# Altium schematic sheet Sheet1.SchDoc (part 2 of 2)
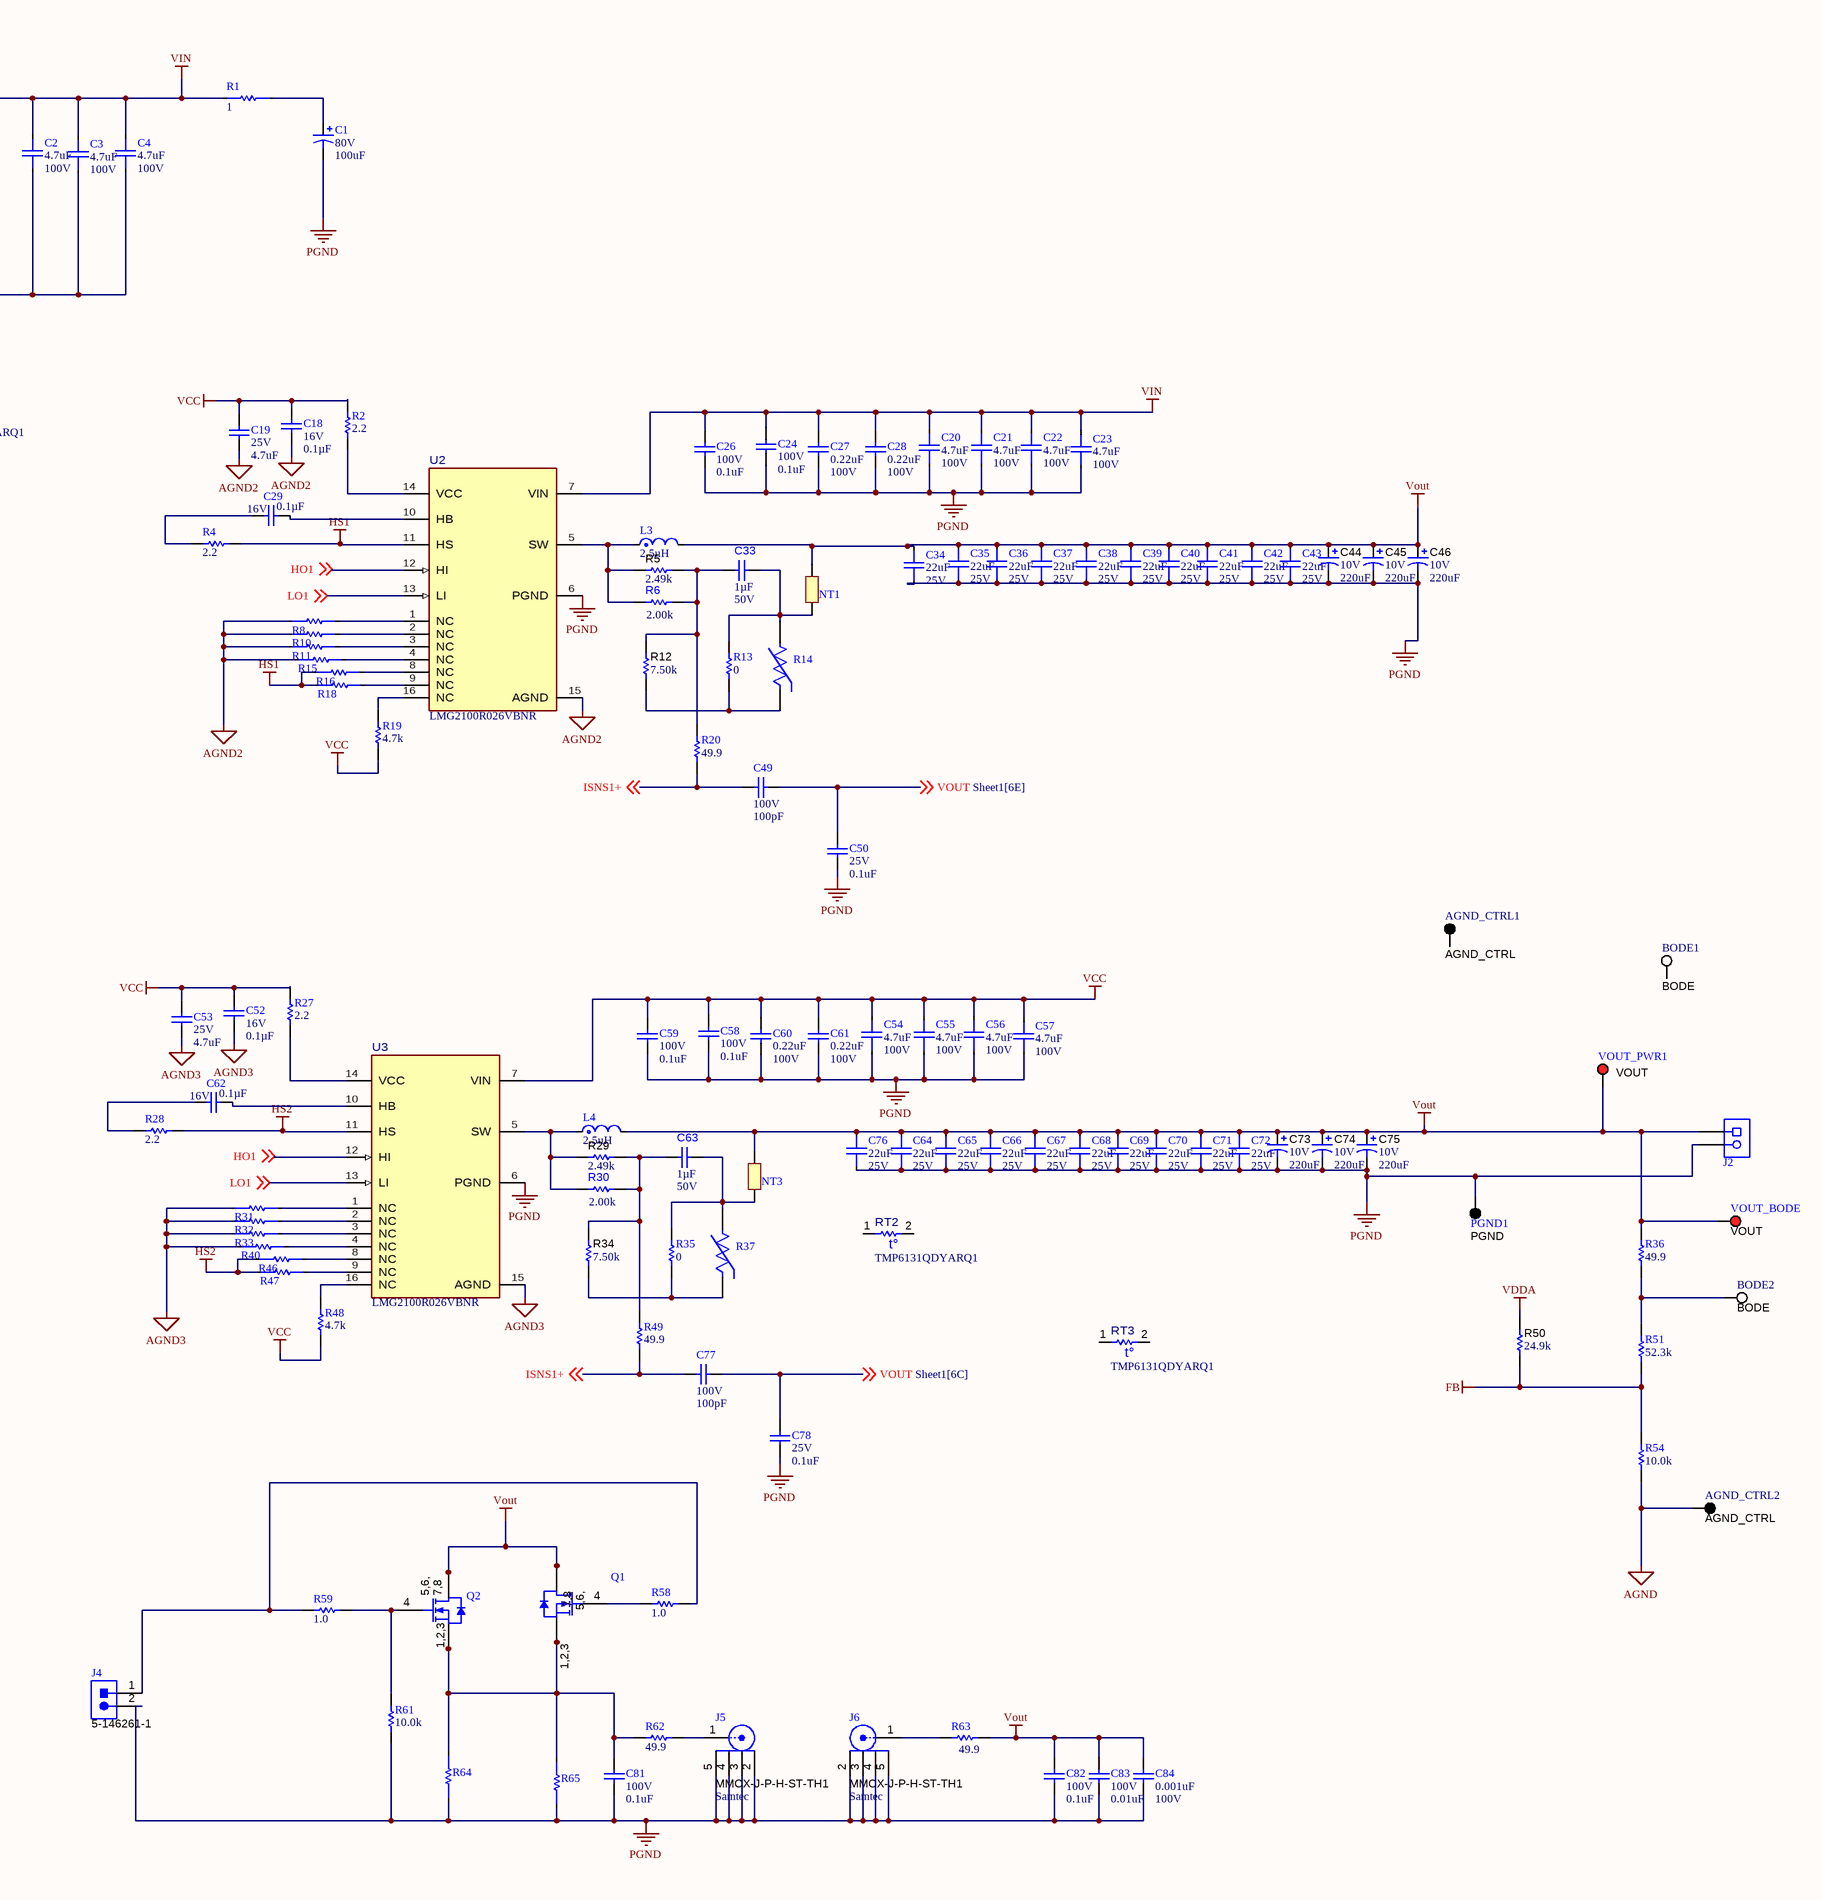
[diagram p2: Sheet1.SchDoc, right]

## Library data of the parts
AGND_CTRL1 AGND_CTRL2 = 5011_AGND_CTRL: Test Point, Multipurpose, Black, TH | PMP23611: AGND_CTRL1; PartNumber: 5011; Manufacturer: Keystone Electronics; CNHeader: FALSE; ContactFinish: Silver; Green_REACh: Passed; Green_Lifecycle: Active; CT: TRUE; ComponentLink1Description: Datasheet URL; Supplier 1: Digi-Key; MountType: TH; Supplier 2: Mouser; LatestRevisionDate: 26/05/2017; Publisher: Texas Instruments; Color: Black; ComponentLink1URL: http://www.keyelco.com/userAssets/file/M60-2p60.pdf; Green_EU RoHS-2: Incomplete; Supplier Part Number 1: 36-5011-ND; Supplier Part Number 2: 534-5011; Green_EU RoHS: Passed; RoHS: Y; PackageReference: Black Multipurpose Testpoint; CompType: Test Point
BODE1 BODE2 = 5012: Test Point, Multipurpose, White, TH | PMP23611: BODE; Manufacturer: Keystone Electronics; ContactFinish: Silver; CT: TRUE; CNHeader: FALSE; Green_Lifecycle: Active; Green_REACh: Passed; Supplier Part Number 2: 534-5012; ComponentLink1Description: Datasheet URL; ComponentLink1URL: http://www.keyelco.com/userAssets/file/M60-2p60.pdf; CompType: Test Point; PackageReference: White Multipurpose Testpoint; RoHS: Y; Green_EU RoHS: Passed; PartNumber: 5012; Green_EU RoHS-2: Incomplete; MountType: TH; Supplier Part Number 1: 36-5012-ND; Color: White; Supplier 2: Mouser; Publisher: Texas Instruments; Supplier 1: Digi-Key; LatestRevisionDate: 26/05/2017
C1 = CMP-0011216-2: CAP, AL, 100 uF, 80 V, +/- 20%, 0.32 ohm, AEC-Q200 Grade 2, SMD; Manufacturer: Panasonic; TaMin_C: -55°C; ESR_ohm: 0.32; Polarized: Y; SizeAreaWB_mm2: 263.5; U/M: EA; Value: 100uF; TaMax_C: 105°C; SizeZ_mm: 13.5; SizeX_mm: 15; Cap_Case: H13; SizeArea_mm2: 202.5; CompType: Capacitor; Cap_F: 100µF; IRMS_A: 500mA; AEC Grade: 2; AEC Category: Q200; Supplier Part Number 2: 667-EEV-FK1K101Q; Publisher: Texas Instruments; Supplier 2: Mouser; Supplier Part Number 3: 9696113; Supplier 3: Farnell; RoHS: Y; Value1: 0.32 ohm; MountType: SMT; Supplier 1: Digi-Key; PackageReference: SMT Radial H13; Tolerance_%: 20%; SizeY_mm: 13.5; Value2: 80V; LatestRevisionDate: 2017-03-09; PartNumber: EEV-FK1K101Q; AEC Qualified: Y; Series: FK; ComponentLink1Description: Datasheet link; Supplier Part Number 1: PCE3493CT-ND; Technology: AL; ComponentLink1URL: https://industrial.panasonic.com/cdbs/www-data/pdf/RDE0000/ABA0000C1181.pdf
C2-C15 C20-C23 C54-C57 = CMP-0093675-1: 4.7uF ±10% 100V Ceramic Capacitor X7S 1210 (3225 Metric); Manufacturer: Murata; Value: 4.7µF; AEC Qualified: Yes; TempCo: 22%; SizeZ_mm: 2.3mm; AEC Grade: Grade 1; Part Number: GCJ32DC72A475KE01L; helpURL: https://upverter.com/upn/revision/54580131a15fb126/; RoHS: TRUE; PartNumber: GCJ32DC72A475KE01L; PackageReference: 1210; ComponentLink1Description: Datasheet; Tolerance_%: 10%; Datasheet Path: datasheets/Cap-GCJ32DC72A475KE01L.pdf; Cap_F: 4.7µF; Lead Free: Yes; Operating Temperature Range: -55°C to +125°C; Temperature Characteristic: X7S; ComponentLink1URL: https://www.murata.com/en-us/products/productdetail?partno=GCJ32DC72A475KE01%23; datasheet: https://www.murata.com/en-us/products/productdetail?partno=GCJ32DC72A475KE01%23
C16 = CMP-0007468-5: CAP, CERM, 0.01 uF, 100 V, +/- 10%, X7R, 0603; Manufacturer: MuRata; TaMin_C: -55°C; Polarized: N; SizeAreaWB_mm2: 4.68; Value1: Unknown; U/M: EA; Value: 0.01uF; TaMax_C: 125°C; SizeZ_mm: 1; SizeX_mm: 1.6; SizeY_mm: 0.8; SizeArea_mm2: 1.28; CompType: Capacitor; Cap_F: 10nF; AEC Category: Q200; Supplier Part Number 2: 81-GRM188R72A103KA1D; Publisher: Texas Instruments; Supplier 2: Mouser; TempCo: X7R; Published: 2008-06-19; RoHS: Y; MountType: SMT; Supplier 1: Digi-Key; PackageReference: 0603; Tolerance_%: 10%; Cap_Case: 0603; LatestRevisionDate: 2017-03-09; PartNumber: GRM188R72A103KA01D; AEC Qualified: ?; VDC_V: 100V; ComponentLink1Description: Datasheet link; Supplier Part Number 1: GRM188R72A103KA01D-ND; Technology: Ceramic; ComponentLink1URL: http://search.murata.co.jp/Ceramy/PnsearchViewAction.do?HnOFG=ON&HnNFG=ON&SEL_CNT=50&sLang=en&sKey=GRM188R72A103KA01D&x=9&y=9&search=startwith
C17 = CMP-0007081-4: CAP, CERM, 1000 pF, 100 V, +/- 10%, X7R, AEC-Q200 Grade 1, 0603; Manufacturer: TDK; TaMin_C: -55°C; ESR_ohm: 1.9714; Polarized: N; SizeAreaWB_mm2: 4.68; Value1: 1.97137 ohm; U/M: EA; Value: 1000pF; TaMax_C: 125°C; SizeZ_mm: 1; SizeX_mm: 1.6; SizeY_mm: 0.8; SizeArea_mm2: 1.28; CompType: Capacitor; AEC Qualified: Y; IRMS_A: 305.705mA; AEC Category: Q200; Supplier Part Number 2: 810-CGA3E2X7R2A102K080AA; Publisher: Texas Instruments; Supplier 2: Mouser; TempCo: X7R; Published: 2008-06-19; RoHS: Y; MountType: SMT; Supplier 1: Digi-Key; PackageReference: 0603; Tolerance_%: 10%; Cap_Case: 0603; Value2: 100V; LatestRevisionDate: 2017-03-09; PartNumber: CGA3E2X7R2A102K080AA; ComponentLink1Description: Datasheet link; AEC Grade: 1; Supplier Part Number 1: 445-5806-1-ND; Technology: Ceramic; ValueDisplayed: 1000pF; ComponentLink1URL: https://product.tdk.com/en/search/capacitor/ceramic/mlcc/info?part_no=CGA3E2X7R2A102K080AA
C18 C29 C52 C62 = CMP-0080702-1: CAP, CERM, 0.1 µF, 16 V,+/- 5%, X7R, AEC-Q200 Grade 1, 0402; Manufacturer: MuRata; Cap_F: 100nF; SizeAreaWB_mm2: 3; SizeArea_mm2: 0.5; AEC Qualified: Y; AEC Category: Q200; Value: 0.1uF; TaMax_C: 125°C; SizeZ_mm: 0.6; AEC Grade: 1; Polarized: N; TaMin_C: -55°C; U/M: EA; CompType: Capacitor; ComponentLink1Description: Datasheet link; RoHS: Y; Tolerance_%: 5%; Supplier 1: Digi-Key; PackageReference: 0402; Technology: Ceramic; PartNumber: GCM155R71C104JA55D; TempCo: X7R; Supplier Part Number 2: 81-GCM155R71C104JA5D; Supplier 2: Mouser; SizeY_mm: 0.5; Value2: 16V; ComponentLink1URL: https://search.murata.co.jp/Ceramy/image/img/A01X/G101/ENG/GCM155R71C104JA55-01.pdf; MountType: SMT; Supplier Part Number 1: 490-16433-1-ND; SizeX_mm: 1; Cap_Case: 0402
C19 C53 = CMP-0008013-2: CAP, CERM, 4.7 uF, 25 V, +/- 10%, X7S, AEC-Q200 Grade 1, 0805; Manufacturer: MuRata; TaMin_C: -55°C; Polarized: N; SizeAreaWB_mm2: 6.75; Value1: Unknown; U/M: EA; Value: 4.7uF; TaMax_C: 125°C; SizeZ_mm: 1.45; SizeX_mm: 2; SizeY_mm: 1.25; Cap_Case: 0805; SizeArea_mm2: 2.5; CompType: Capacitor; AEC Qualified: Y; Cap_F: 4.7µF; AEC Grade: 1; AEC Category: Q200; Publisher: Texas Instruments; TempCo: X7S; Published: 2008-06-19; RoHS: Y; MountType: SMT; Supplier 1: Mouser; PackageReference: 0805; Tolerance_%: 10%; Value2: 25V; LatestRevisionDate: 2017-03-09; PartNumber: GCM21BC71E475KE36L; ComponentLink1Description: Datasheet link; Supplier Part Number 1: 81-GCM21BC71E475KE6L; Technology: Ceramic; ComponentLink1URL: http://psearch.en.murata.com/capacitor/product/GCM21BC71E475KE36%23.pdf
C24 C26 C30 C58 C59 = CMP-0007469-4: CAP, CERM, 0.1 uF, 100 V, +/- 10%, X7R, 0603; Manufacturer: MuRata; TaMin_C: -55°C; Polarized: N; SizeAreaWB_mm2: 4.68; Value1: Unknown; U/M: EA; Value: 0.1uF; TaMax_C: 125°C; SizeZ_mm: 1; SizeX_mm: 1.6; SizeY_mm: 0.8; SizeArea_mm2: 1.28; CompType: Capacitor; Cap_F: 100nF; AEC Category: Q200; Supplier Part Number 2: 81-GRM188R72A104KA35; Publisher: Texas Instruments; Supplier 2: Mouser; Supplier Part Number 3: 1828921; TempCo: X7R; Supplier 3: Farnell; Published: 2008-06-19; RoHS: Y; MountType: SMT; Supplier 1: Digi-Key; PackageReference: 0603; Tolerance_%: 10%; Cap_Case: 0603; LatestRevisionDate: 2017-03-09; PartNumber: GRM188R72A104KA35D; AEC Qualified: ?; VDC_V: 100V; ComponentLink1Description: Datasheet link; Supplier Part Number 1: 490-3285-1-ND; Technology: Ceramic; ComponentLink1URL: http://search.murata.co.jp/Ceramy/PnsearchViewAction.do?HnOFG=ON&HnNFG=ON&SEL_CNT=50&sLang=en&sKey=GRM188R72A104KA35D&x=9&y=9&search=startwith
C25 C47 C48 C50 C51 C78 = CMP-0007077-5: CAP, CERM, 0.1 uF, 25 V, +/- 10%, X7R, AEC-Q200 Grade 1, 0603; Manufacturer: TDK; TaMin_C: -55°C; Polarized: N; SizeAreaWB_mm2: 4.68; Value1: Unknown; U/M: EA; Value: 0.1uF; TaMax_C: 125°C; SizeZ_mm: 1; SizeX_mm: 1.6; SizeY_mm: 0.8; SizeArea_mm2: 1.28; CompType: Capacitor; AEC Qualified: Y; Cap_F: 100nF; AEC Category: Q200; Supplier Part Number 2: 79Y4100; Publisher: Texas Instruments; Supplier 2: Newark; Supplier Part Number 3: 810-CGA3E2X7R1E104K; TempCo: X7R; Supplier 3: Mouser; Published: 2008-06-19; RoHS: Y; MountType: SMT; Supplier 1: Digi-Key; PackageReference: 0603; Tolerance_%: 10%; Cap_Case: 0603; LatestRevisionDate: 2017-03-09; PartNumber: CGA3E2X7R1E104K080AA; VDC_V: 25V; ComponentLink1Description: Datasheet link; Supplier Part Number 1: 445-5667-1-ND; Technology: Ceramic; ComponentLink1URL: https://product.tdk.com/info/en/documents/chara_sheet/CGA3E2X7R1E104K080AA.pdf; AEC Grade: 1
C27 C28 C60 C61 = CMP-0007996-2: CAP, CERM, 0.22 uF, 100 V, +/- 10%, X7R, 0805; Manufacturer: Samsung Electro-Mechanics; TaMin_C: -55°C; Polarized: N; SizeAreaWB_mm2: 6.75; Value1: Unknown; U/M: EA; Value: 0.22uF; TaMax_C: 125°C; SizeZ_mm: 1.45; SizeX_mm: 2; SizeY_mm: 1.25; SizeArea_mm2: 2.5; CompType: Capacitor; AEC Category: Q200; Publisher: Texas Instruments; TempCo: X7R; Published: 2008-06-19; RoHS: Y; MountType: SMT; PackageReference: 0805; Tolerance_%: 10%; Cap_Case: 0805; Value2: 100V; LatestRevisionDate: 2017-03-09; PartNumber: CL21B224KCFSNWE; AEC Qualified: ?; ComponentLink1Description: Datasheet link; Technology: Ceramic; ValueDisplayed: 0.22uF; ComponentLink1URL: http://www.samsungsem.com/servlet/FileDownload?type=spec&file=CL21B224KCFSNWE.pdf
C31 = CMP-0064936-4: CAP, CERM, 4.7 uF, 16 V,+/- 10%, X7R, 0603; Manufacturer: MuRata; TaMin_C: -55°C; Polarized: N; SizeAreaWB_mm2: 4.68; Value1: Unknown; U/M: EA; Value: 4.7uF; TaMax_C: 125°C; SizeZ_mm: 1; SizeX_mm: 1.6; SizeY_mm: 0.8; SizeArea_mm2: 1.28; CompType: Capacitor; AEC Category: Q200; Publisher: Texas Instruments; TempCo: X7R; Published: 2008-06-19; RoHS: Y; MountType: SMT; PackageReference: 0603; Tolerance_%: 10%; Cap_Case: 0603; LatestRevisionDate: 2017-06-05; PartNumber: GRM188Z71C475KE21D; AEC Qualified: N; VDC_V: 16V; ComponentLink1Description: Datasheet link; AEC Grade: N/A; Technology: Ceramic; ValueDisplayed: 4.7uF; ComponentLink1URL: http://search.murata.co.jp/Ceramy/image/img/A01X/G101/ENG/GRM188Z71C475KE21-01.pdf
C32 = CMP-0079154-1: CAP, CERM, 1 µF, 16 V,+/- 10%, X7R, AEC-Q200 Grade 1, 0603; Manufacturer: MuRata; SizeAreaWB_mm2: 4.68; SizeArea_mm2: 1.28; AEC Qualified: Y; AEC Category: Q200; Value: 1uF; TaMax_C: 125°C; SizeZ_mm: 1; Polarized: N; TaMin_C: -55°C; SizeY_mm: 0.8; U/M: EA; CompType: Capacitor; SizeX_mm: 1.6; Cap_Case: 0603; ComponentLink1Description: Datasheet link; RoHS: Y; Tolerance_%: 10%; Supplier 1: Digi-Key; PackageReference: 0603; Technology: Ceramic; PartNumber: GCM188R71C105KA64J; TempCo: X7R; Supplier Part Number 2: 81-GCM188R71C105KA4J; Supplier 2: Mouser; AEC Grade: 1; Value2: 16V; ComponentLink1URL: https://www.murata.com/~/media/webrenewal/support/library/catalog/products/capacitor/mlcc/c03e.ashx; MountType: SMT; Supplier Part Number 1: 490-12657-1-ND; ValueDisplayed: 1µF
C33 C63 = CMP-0007508-5: CAP, CERM, 1 uF, 50 V, +/- 10%, X7R, 0603; Manufacturer: Taiyo Yuden; SizeAreaWB_mm2: 4.68; SizeArea_mm2: 1.28; AEC Category: Q200; Value: 1uF; TaMax_C: 125°C; SizeZ_mm: 1; Polarized: N; TaMin_C: -55°C; SizeY_mm: 0.8; U/M: EA; CompType: Capacitor; SizeX_mm: 1.6; Value1: Unknown; ComponentLink1Description: Datasheet link; RoHS: Y; Tolerance_%: 10%; Supplier 1: Digi-Key; AEC Qualified: ?; PackageReference: 0603; Technology: Ceramic; PartNumber: UMK107AB7105KA-T; TempCo: X7R; Supplier Part Number 2: 45W1781; Supplier 2: Newark; Value2: 50V; ComponentLink1URL: http://www.yuden.co.jp/ut/product/category/capacitor/UMK107AB7105KA-T.pdf; MountType: SMT; Supplier Part Number 1: 587-3247-1-ND; Cap_Case: 0603; ValueDisplayed: 1uF; Supplier 3: Mouser; Supplier Part Number 3: 963-UMK107AB7105KA-T; Publisher: Texas Instruments; Published: 2008-06-19; LatestRevisionDate: 2017-03-09
C34-C43 C64-C72 C76 = CMP-0036912-1: Cap Ceramic 22uF 25V X7R 20% Pad SMD 1210 +125°C Automotive T/R; Manufacturer: TDK; AEC Grade: Grade 1; AEC Qualified: Yes; Cap_F: 22µF; SizeZ_mm: 2.8mm; TempCo: 15%; Tolerance_%: 0.2%; Value: 22µF; PackageReference: 1210; PartNumber: CGA6P3X7R1E226M250AB; RoHS: TRUE; Part Number: CGA6P3X7R1E226M250AB; datasheet: https://product.tdk.com/info/en/catalog/spec/mlccspec_automotive_general_en.pdf; Datasheet Path: datasheets/Cap-CGA6P3X7R1E226M250AB.pdf; helpURL: https://upverter.com/upn/revision/061270d54d6f8474/; Lead Free: Yes; Operating Temperature Range: -55°C to +125°C; Temperature Characteristic: X7R; ComponentLink1Description: Datasheet; ComponentLink1URL: https://product.tdk.com/info/en/catalog/spec/mlccspec_automotive_general_en.pdf
C44-C46 C73-C75 = CMP-0012661-3: CAP, Tantalum Polymer, 220 uF, 10 V, +/- 20%, 0.025 ohm, AEC-Q200 Grade 1, 7343-31 SMD; Manufacturer: Kemet; TaMin_C: -55°C; ESR_ohm: 0.025; Polarized: Y; SizeAreaWB_mm2: 58.59; Value: 220uF; TaMax_C: 125°C; SizeZ_mm: 3.1; SizeX_mm: 7.3; SizeY_mm: 4.3; Cap_Case: 7.3x4.3x3.1mm; SizeArea_mm2: 31.39; CompType: Capacitor; Cap_F: 220µF; IRMS_A: 3A; AEC Grade: 1; AEC Category: Q200; Supplier Part Number 2: 80-T598D227M010E025; Supplier 2: Mouser; Supplier Part Number 3: 2491741; Supplier 3: Farnell; RoHS: Y; Value1: 0.025 ohm; MountType: SMT; Supplier 1: Digi-Key; PackageReference: 7343-31; Tolerance_%: 20%; Value2: 10V; PartNumber: T598D227M010ATE025; AEC Qualified: Y; Series: T598; ComponentLink1Description: Datasheet link; Supplier Part Number 1: 399-12102-1-ND; Technology: Tantalum Polymer; ComponentLink1URL: http://www.kemet.com/Lists/ProductCatalog/Attachments/637/KEM_T2073_T591_T598.pdf
C49 C77 = GCM1885C2A101JA16D: CAP, CERM, 100 pF, 100 V, +/- 5%, C0G/NP0, AEC-Q200 Grade 1, 0603 | PMP23611: C69, C43; Manufacturer: MuRata; TaMin_C: -55°C; Polarized: N; SizeAreaWB_mm2: 4.68; Value1: Unknown; U/M: EA; TaMax_C: 125°C; SizeZ_mm: 1; SizeX_mm: 1.6; SizeY_mm: 0.8; SizeArea_mm2: 1.28; CompType: Capacitor; AEC Qualified: Y; AEC Category: Q200; Value: 100pF; Supplier Part Number 2: 81-GCM1885C2A101JA6D; Publisher: Texas Instruments; Supplier 2: Mouser; TempCo: C0G/NP0; Published: 2008-06-19; RoHS: Y; MountType: SMT; Supplier 1: Digi-Key; PackageReference: 0603; Tolerance_%: 5%; Cap_Case: 0603; Value2: 100V; LatestRevisionDate: 2017-03-09; PartNumber: GCM1885C2A101JA16D; Cap_F: 100pF; ComponentLink1Description: Datasheet link; AEC Grade: 1; Supplier Part Number 1: 490-4771-1-ND; Technology: Ceramic; ComponentLink1URL: http://psearch.murata.com/capacitor/product/GCM1885C2A101JA16%23.pdf
C79 = CMP-0006768-4: CAP, CERM, 150 pF, 50 V, +/- 5%, C0G/NP0, 0603; Manufacturer: AVX; TaMin_C: -55°C; ESR_ohm: 0.098; Polarized: N; SizeAreaWB_mm2: 4.68; Value1: 0.098 ohm; U/M: EA; Value: 150pF; TaMax_C: 125°C; SizeZ_mm: 1; SizeX_mm: 1.6; SizeY_mm: 0.8; SizeArea_mm2: 1.28; CompType: Capacitor; AEC Category: Q200; Supplier Part Number 2: 09J2473; Publisher: Texas Instruments; Supplier 2: Newark; Supplier Part Number 3: 581-06035A151J; TempCo: C0G/NP0; Supplier 3: Mouser; Published: 2008-06-19; RoHS: Y; MountType: SMT; Supplier 1: Digi-Key; PackageReference: 0603; Tolerance_%: 5%; Cap_Case: 0603; Value2: 50V; LatestRevisionDate: 2017-03-09; PartNumber: 06035A151JAT2A; AEC Qualified: N; Cap_F: 150pF; ComponentLink1Description: Datasheet link; AEC Grade: N/A; Supplier Part Number 1: 478-1177-1-ND; Technology: Ceramic; ComponentLink1URL: http://datasheets.avx.com/C0GNP0-Dielectric.pdf
C80 = CMP-0006942-4: CAP, CERM, 4700 pF, 50 V, +/- 5%, X7R, 0603; Manufacturer: Kemet; TaMin_C: -55°C; Polarized: N; SizeAreaWB_mm2: 4.68; Value1: Unknown; U/M: EA; Value: 4700pF; TaMax_C: 125°C; SizeZ_mm: 1; SizeX_mm: 1.6; SizeY_mm: 0.8; SizeArea_mm2: 1.28; CompType: Capacitor; AEC Category: Q200; Supplier Part Number 2: 80-C0603C472J5R; Publisher: Texas Instruments; Supplier 2: Mouser; Supplier Part Number 3: 9934952; TempCo: X7R; Supplier 3: Farnell; Published: 2008-06-19; RoHS: Y; MountType: SMT; Supplier 1: Digi-Key; PackageReference: 0603; Tolerance_%: 5%; Cap_Case: 0603; Value2: 50V; LatestRevisionDate: 2017-03-09; PartNumber: C0603C472J5RACTU; AEC Qualified: ?; ComponentLink1Description: Datasheet link; Supplier Part Number 1: 399-1088-1-ND; Technology: Ceramic; ValueDisplayed: 4700pF; ComponentLink1URL: http://www.kemet.com/kemet/web/homepage/kechome.nsf/vapubfiles/F3102_Y5V.pdf/$file/F3102_Y5V.pdf
C81 C82 = GRM188R72A104KA35D: CAP, CERM, 0.1 uF, 100 V, +/- 10%, X7R, 0603 | PMP23611: C39; Manufacturer: MuRata; TaMin_C: -55°C; Polarized: N; SizeAreaWB_mm2: 4.68; Value1: Unknown; U/M: EA; Value: 0.1uF; TaMax_C: 125°C; SizeZ_mm: 1; SizeX_mm: 1.6; SizeY_mm: 0.8; SizeArea_mm2: 1.28; CompType: Capacitor; Cap_F: 100nF; AEC Category: Q200; Supplier Part Number 2: 81-GRM188R72A104KA35; Publisher: Texas Instruments; Supplier 2: Mouser; Supplier Part Number 3: 1828921; TempCo: X7R; Supplier 3: Farnell; Published: 2008-06-19; RoHS: Y; MountType: SMT; Supplier 1: Digi-Key; PackageReference: 0603; Tolerance_%: 10%; Cap_Case: 0603; LatestRevisionDate: 2017-03-09; PartNumber: GRM188R72A104KA35D; AEC Qualified: ?; VDC_V: 100V; ComponentLink1Description: Datasheet link; Supplier Part Number 1: 490-3285-1-ND; Technology: Ceramic; ComponentLink1URL: http://search.murata.co.jp/Ceramy/PnsearchViewAction.do?HnOFG=ON&HnNFG=ON&SEL_CNT=50&sLang=en&sKey=GRM188R72A104KA35D&x=9&y=9&search=startwith
C83 = GRM188R72A103KA01D: CAP, CERM, 0.01 uF, 100 V, +/- 10%, X7R, 0603 | PMP23611: C58, C3; Manufacturer: MuRata; TaMin_C: -55°C; Polarized: N; SizeAreaWB_mm2: 4.68; Value1: Unknown; U/M: EA; Value: 0.01uF; TaMax_C: 125°C; SizeZ_mm: 1; SizeX_mm: 1.6; SizeY_mm: 0.8; SizeArea_mm2: 1.28; CompType: Capacitor; Cap_F: 10nF; AEC Category: Q200; Supplier Part Number 2: 81-GRM188R72A103KA1D; Publisher: Texas Instruments; Supplier 2: Mouser; TempCo: X7R; Published: 2008-06-19; RoHS: Y; MountType: SMT; Supplier 1: Digi-Key; PackageReference: 0603; Tolerance_%: 10%; Cap_Case: 0603; LatestRevisionDate: 2017-03-09; PartNumber: GRM188R72A103KA01D; AEC Qualified: ?; VDC_V: 100V; ComponentLink1Description: Datasheet link; Supplier Part Number 1: GRM188R72A103KA01D-ND; Technology: Ceramic; ComponentLink1URL: http://search.murata.co.jp/Ceramy/PnsearchViewAction.do?HnOFG=ON&HnNFG=ON&SEL_CNT=50&sLang=en&sKey=GRM188R72A103KA01D&x=9&y=9&search=startwith
C84 = CGA3E2X7R2A102K080AA: CAP, CERM, 1000 pF, 100 V, +/- 10%, X7R, AEC-Q200 Grade 1, 0603 | PMP23611: C57, C2; Manufacturer: TDK; TaMin_C: -55°C; ESR_ohm: 1.9714; Polarized: N; SizeAreaWB_mm2: 4.68; Value1: 1.97137 ohm; U/M: EA; Value: 1000pF; TaMax_C: 125°C; SizeZ_mm: 1; SizeX_mm: 1.6; SizeY_mm: 0.8; SizeArea_mm2: 1.28; CompType: Capacitor; AEC Qualified: Y; IRMS_A: 305.705mA; AEC Category: Q200; Supplier Part Number 2: 810-CGA3E2X7R2A102K080AA; Publisher: Texas Instruments; Supplier 2: Mouser; TempCo: X7R; Published: 2008-06-19; RoHS: Y; MountType: SMT; Supplier 1: Digi-Key; PackageReference: 0603; Tolerance_%: 10%; Cap_Case: 0603; Value2: 100V; LatestRevisionDate: 2017-03-09; PartNumber: CGA3E2X7R2A102K080AA; ComponentLink1Description: Datasheet link; AEC Grade: 1; Supplier Part Number 1: 445-5806-1-ND; Technology: Ceramic; ValueDisplayed: 1000pF; ComponentLink1URL: https://product.tdk.com/en/search/capacitor/ceramic/mlcc/info?part_no=CGA3E2X7R2A102K080AA
GND1 = CMP-0055148-1: Test Point, Multipurpose, Black, TH; Manufacturer: Keystone; PartNumber: 5011; CNHeader: FALSE; Green_Lifecycle: Active; Green_REACh: Passed; ContactFinish: Silver; CT: TRUE; ComponentLink1URL: http://www.keyelco.com/userAssets/file/M60-2p60.pdf; Supplier Part Number 2: 534-5011; Publisher: Texas Instruments; Supplier 2: Mouser; Color: Black; RoHS: Y; MountType: TH; Green_EU RoHS-2: Incomplete; Supplier 1: Digi-Key; Green_EU RoHS: Passed; PackageReference: Black Multipurpose Testpoint; CompType: Test Point; LatestRevisionDate: 26/05/2017; ComponentLink1Description: Datasheet URL; Supplier Part Number 1: 36-5011-ND
J1 J2 = CMP-0077513-2: Terminal Block, 10.16mm, 2x1, Tin, R/A, TH; Manufacturer: Eaton; Pitch_mm: 10.16; Gender: Female; Voltage_V: 300V; Current_A: 65A; Cert_CULUS: Y; Row_Count: 1; ComponentLink1Description: Datasheet URL; RoHS: Y; Supplier Part Number 3: 504-EM292902-UL; Supplier 1: Digi-Key; Orientation: R/A; PackageReference: Terminal Block, 10.16mm, 2x1, TH; Color: Green; PartNumber: EM292902-UL; PinCount: 2; Supplier Part Number 2: 79T1137; ContactFinish: Tin; Supplier 2: Newark; ComponentLink1URL: http://www.cooperindustries.com/content/dam/public/bussmann/Electronics/Resources/product-datasheets/Connectors/Bus_Elx_DS_EM2929_High_Current.pdf; CompType: Terminal Block; MountType: TH; Supplier Part Number 1: 283-4339-ND; Supplier 3: Mouser
J3 = CMP-0075428-1: Header, 100mil, 14x1, Gold, TH; Manufacturer: Samtec; Pitch_mm: 2.54; Cert_VDE: N; Gender: Male; Cert_CSA: Y; Voltage_V: 550V; Green_REACh: Passed; Current_A: 6.3A; CT: False; Green_Lifecycle: Active; Row_Count: 1; CNHeader: True; ComponentLink1Description: Datasheet URL; RoHS: Y; Supplier 1: Digi-Key; Cert_UL: Y; Orientation: Vertical; Green_EU RoHS: Passed; PackageReference: 14x1 Header; Color: Black; PartNumber: TSW-114-07-G-S; PinCount: 14; Publisher: Texas Instruments; ContactFinish: Gold; Cert_CULUS: N; Shrouded: N; ClassName: Header; ComponentLink1URL: http://samtec.com/ftppub/pdf/TSW_TH.PDF; LatestRevisionDate: 2017-07-12; CompType: Header; MountType: TH; Supplier Part Number 1: SAM1029-14-ND; Green_EU RoHS-2: Passed
J4 = 5-146261-1: Header, 100mil, 2x1, Gold, TH | PMP23611: J4; Manufacturer: TE Connectivity; Green_Lifecycle: Active; Green_REACh: Passed; CNHeader: TRUE; CT: FALSE; PartNumber: 5-146261-1; PackageReference: Header, 2x1, 100mil; ClassName: Header; CompType: Header; RoHS: Y; MountType: TH; ComponentLink1Description: Datasheet URL; ComponentLink1URL: https://sps06.itg.ti.com/sites/KMS/crossdivteams/altium/docs/ComponentDatasheets/ENG_CD_146261_G2.pdf; Publisher: Texas Instruments; LatestRevisionDate: 26/05/2017; Green_EU RoHS: Passed; Green_EU RoHS-2: Incomplete
J5 J6 = MMCX-J-P-H-ST-TH1: Connector, MMCX 50 ohm, TH | PMP23611: J5, J6; CT: False; Gender: Female; PartNumber: MMCX-J-P-H-ST-TH1; Publisher: Texas Instruments; PackageReference: Connector, MMCX, TH; CompType: Connector; LatestRevisionDate: 2017-07-12; Supplier Part Number 1: 88K0549; Orientation: Vertical; ComponentLink1Description: Datasheet URL; ComponentLink1URL: http://suddendocs.samtec.com/prints/mmcx-j-p-x-st-th1-mkt.pdf; Supplier 1: Newark; MountType: TH; RoHS: Y; CNHeader: False
L1 = CMP-0086238-1: Inductor, 1 µH, 30 A, 0.00276 ohm, AEC-Q200 Grade 0, SMD; Manufacturer: Cyntec; AEC Category: Q200; AEC Grade: 0; Value: 1uH; AEC Qualified: Y; Irms: 30A @ 40C rise; Isat: 37A @ 30% inductance drop; DCR_ohm: 2.76m; SizeX_mm: 10.85; Imax_A: 30A; SizeArea_mm2: 108.5; SizeZ_mm: 5.4; SizeAreaWB_mm2: 154.2; SizeY_mm: 10; Material: ?; PackageReference: 10.85x10mm; RoHS: Y; Technology: ?; ComponentLink1Description: Datasheet link; MountType: SMT; Value1: 0.00276 ohm; Ind_H: 1µH; ComponentLink1URL: http://www.cyntec.com/upfile/products/download/VCHA105D.pdf; CompType: Inductor; PartNumber: VCHA105D-1R0MS6; Value2: 30A
L2 = CMP-0084205-1: Coupled inductor, 16 µH, 0.0027 ohm, TH; Manufacturer: Wurth Elektronik; AEC Category: Q200; AEC Qualified: N; DCR_ohm: 2.7m; ComponentLink1URL: http://katalog.we-online.de/pbs/datasheet/7448421016.pdf; Ind_H: 16µH; CompType: Coupled Inductor; PackageReference: 18.5x14.5mm; RoHS: Y; AEC Grade: N/A; PartNumber: 7448421016; MountType: TH; ComponentLink1Description: Datasheet URL
L3 L4 = CMP-0047844-1: Power Choke Coil 2.5uH 20% 100kHz 2.53mOhm 32A AECQ200 13.3x12.8x8.0mm SMT; Manufacturer: CYNTEC; AEC Grade: Grade 0; AEC Qualified: Yes; DCR_ohm: 2.53m; Ind_H: 2.5µH; Isat: 30A; Material: Metal Dust; SizeZ_mm: 8mm; Irms: 32A; PackageReference: SMT_IND_13MM3_12MM8; PartNumber: VCUD128T-2R5MS8; RoHS: TRUE; Part Number: VCUD128T-2R5MS8; Datasheet Path: datasheets/Ind-VCUD128T-2R5MS8.pdf; helpURL: https://upverter.com/upn/revision/c76fce19a578f743/; Lead Free: Yes; Operating Temperature Range: -55°C to +180°C; Test Frequency: 100kHz; Tolerance_%: 20%
NT1-NT3 = CMP-0078142-6: Single point connection between nets.; MountType: SMT; PackageReference: N/A; CompType: Net-Tie; Manufacturer: N/A; PartNumber: N/A; Library Reference: Net-Tie
PGND1 = 5011: Test Point, Multipurpose, Black, TH | PMP23611: GND1, PGND1; Manufacturer: Keystone; CNHeader: FALSE; Green_Lifecycle: Active; Green_REACh: Passed; ContactFinish: Silver; CT: TRUE; ComponentLink1URL: http://www.keyelco.com/userAssets/file/M60-2p60.pdf; Supplier Part Number 2: 534-5011; Publisher: Texas Instruments; Supplier 2: Mouser; Color: Black; RoHS: Y; MountType: TH; Green_EU RoHS-2: Incomplete; Supplier 1: Digi-Key; Green_EU RoHS: Passed; PackageReference: Black Multipurpose Testpoint; CompType: Test Point; LatestRevisionDate: 26/05/2017; PartNumber: 5011; ComponentLink1Description: Datasheet URL; Supplier Part Number 1: 36-5011-ND
Q1 Q2 = CSD17570Q5B: MOSFET, N-CH, 30 V, 51 A, DNK0008A (VSON-CLIP-8) | PMP23611: Q1, Q2; Alternate Manufacturer: None; Manufacturer: Texas Instruments; SizeZ_mm: 1; ChType: N; Value2: 97 nC; Value1: 0.007; VdsMax_V: 30V; SizeX_mm: 6; SizeAreaWB_mm2: 56; SizeY_mm: 5; Vgs_V: 20V; QgTyp_nC: 97; Value: 30V; Rdson45_ohm: 7.6m; SizeArea_mm2: 30; AEC Category: Q101; IdsMax_A: 51A; U/M: EA; PartNumber: CSD17570Q5B; ComponentLink1Description: Datasheet link; ComponentLink1URL: http://www.ti.com/lit/ds/symlink/csd17570q5b.pdf; CompType: MOSFET; AEC Qualified: N; RoHS: Y; PackageReference: DNK0008A; MountType: SMT
R1 = CMP-0084352-2: 1 Ohms ±1% 2W Chip Resistor Wide 2512 (6432 Metric), 1225 Automotive AEC-Q200 Thick Film; Manufacturer: Vishay Dale; SizeZ_mm: 0.8mm; Symbol Name: SYM-RCL12251R00FKEG; TempCo: 100ppm/°C; VDC_V: 200V; AEC Qualified: Yes; AEC Grade: Grade 0; Operating Temperature Range: -55°C to +155°C; ComponentLink1URL: http://www.vishay.com/docs/20046/rcle3.pdf; Lead Free: Yes; Digikey Part Number: RCL1.00ECT-ND; datasheet: http://www.vishay.com/docs/20046/rcle3.pdf; Technology: Thick Film; PackageReference: 2512; Datasheet Path: datasheets/Res_RCL12251R00FKEG.pdf; Digikey Description: RES SMD 1 OHM 2W 2512 WIDE; Res_ohm: 1; ComponentLink1Description: Datasheet; Power_W: 2W; PartNumber: RCL12251R00FKEG; RoHS: TRUE; Ipc Land Pattern Name: RESC320630X70; helpURL: https://upverter.com/upn/revision/76b409d4a36248c1/; Tolerance_%: 1%; Part Number: RCL12251R00FKEG; Series: RCLe3; Mouser Part Number: 71-RCL12251R00FKEG; Mouser Description: Thick Film Resistors - SMD 2watt 1ohm 1% 100ppm 1225
R2 R4 R27 R28 = CMP-0026898-3: RES, 2.2, 5%, 0.063 W, AEC-Q200 Grade 0, 0402; Manufacturer: Vishay-Dale; Power_W: 63mW; TempCo: 200 ppm/C; Value_Code: 2R20; Value: 2.2; EIA_Code: E24; SizeX_mm: 1; SizeY_mm: 0.5; SizeZ_mm: 0.6; Value2: 0.063W; CompType: Resistor; AEC Qualified: Y; VDC_V: 50V; AEC Category: Q200; AEC Grade: 0; Supplier Part Number 2: 59M6713; Supplier 2: Newark; Supplier Part Number 3: 71-CRCW0402J-2.2-E3; Supplier 3: Mouser; RoHS: E; Value1: 5%; MountType: SMT; Supplier 1: Digi-Key; PackageReference: 0402; Tolerance_%: 5%; Res_ohm: 2.2; SizeArea_mm2: 0.5; PartNumber: CRCW04022R20JNED; ComponentLink1Description: Datasheet link; Supplier Part Number 1: 541-2.2JCT-ND; Technology: Thick Film; ComponentLink1URL: http://www.vishay.com/docs/20035/dcrcwe3.pdf
R3 R8 R10 R11 R15 R16 R18 R21 R31-R33 R40 R46 R47 R64 R65 = CMP-0122893-1: RES Thick Film, 0Ω, , 0.33W, , 0603; Manufacturer: Vishay; AEC Grade: Grade 0; AEC Qualified: Yes; Power_W: 330mW; Res_ohm: 0; SizeZ_mm: 0.55mm; VDC_V: 75V; Power: 250mW; Value: 0; PackageReference: 0603; PartNumber: CRCW06030000Z0EAHP; RoHS: TRUE; Technology: Thick Film; Part Number: CRCW06030000Z0EAHP; datasheet: http://www.vishay.com/docs/20043/crcwhpe3.pdf; Datasheet Path: datasheets/Res-CRCW06030000Z0EAHP.pdf; helpURL: https://upverter.com/upn/revision/7731518622f7bb63/; Lead Free: Yes; Operating Temperature Range: -55°C to +155°C; Series: CRCW-HP e3; ComponentLink1Description: Datasheet; ComponentLink1URL: http://www.vishay.com/docs/20043/crcwhpe3.pdf
R5 R29 = CMP-0083024-1: RES, 2.49 k, 1%, 0.5 W, 1210; Manufacturer: Yageo; Power_W: 500mW; TempCo: 100 ppm/C; SizeAreaWB_mm2: 14.7; Value_Code: 2k49; Value: 2.49k; EIA_Code: E96; SizeX_mm: 3.2; SizeY_mm: 2.5; SizeZ_mm: 1.35; Value2: 0.5W; SizeArea_mm2: 8; CompType: Resistor; AEC Qualified: N; VDC_V: 200V; AEC Category: Q200; ComponentLink1URL: http://www.yageo.com/documents/recent/PYu-RC1210_51_RoHS_L_(4).pdf; RoHS: Y; Value1: 1%; MountType: SMT; PackageReference: 1210; Tolerance_%: 1%; Res_ohm: 2.49k; PartNumber: RC1210FR-072K49L; ComponentLink1Description: Datasheet link; AEC Grade: N/A; Technology: Thick Film
R6 R30 = CMP-0083034-1: RES, 2.00 k, 1%, 0.5 W, 1210; Manufacturer: Yageo; Power_W: 500mW; TempCo: 100 ppm/C; Value_Code: 2k00; Value: 2.00k; EIA_Code: E96; Res_ohm: 2k; SizeX_mm: 3.2; SizeY_mm: 2.5; SizeZ_mm: 1.35; Value2: 0.5W; SizeArea_mm2: 8; CompType: Resistor; AEC Qualified: N; VDC_V: 200V; AEC Category: Q200; SizeAreaWB_mm2: 14.7; RoHS: Y; Value1: 1%; MountType: SMT; PackageReference: 1210; Tolerance_%: 1%; PartNumber: RC1210FR-072KL; ComponentLink1Description: Datasheet link; Technology: Thick Film; ComponentLink1URL: http://www.yageo.com/documents/recent/PYu-RC1210_51_RoHS_L_(4).pdf; AEC Grade: N/A
R7 R17 R22 R26 R39 R43 R55-R57 = CMP-0021998-4: RES, 10.0 k, 1%, 0.1 W, AEC-Q200 Grade 0, 0603; Manufacturer: Vishay-Dale; Power_W: 100mW; TempCo: 100 ppm/C; Value_Code: 10k0; Value: 10.0k; EIA_Code: E96; Res_ohm: 10k; SizeX_mm: 1.6; SizeY_mm: 0.8; SizeZ_mm: 1; Value2: 0.1W; SizeArea_mm2: 1.28; CompType: Resistor; AEC Qualified: Y; VDC_V: 75V; AEC Category: Q200; AEC Grade: 0; Supplier Part Number 2: 52K8062; Supplier 2: Newark; Supplier Part Number 3: 71-CRCW0603-10K-E3; Supplier 3: Mouser; RoHS: E; Value1: 1%; MountType: SMT; Supplier 1: Digi-Key; PackageReference: 0603; Tolerance_%: 1%; PartNumber: CRCW060310K0FKEA; ComponentLink1Description: Datasheet link; Supplier Part Number 1: 541-10.0KHCT-ND; Technology: Thick Film; ComponentLink1URL: http://www.vishay.com/docs/20035/dcrcwe3.pdf
R9 R25 = CMP-0022486-4: RES, 52.3 k, 1%, 0.1 W, AEC-Q200 Grade 0, 0603; Manufacturer: Vishay-Dale; Power_W: 100mW; TempCo: 100 ppm/C; Value_Code: 52k3; Value: 52.3k; EIA_Code: E96; SizeX_mm: 1.6; SizeY_mm: 0.8; SizeZ_mm: 1; Value2: 0.1W; SizeArea_mm2: 1.28; CompType: Resistor; AEC Qualified: Y; VDC_V: 75V; AEC Category: Q200; AEC Grade: 0; Supplier Part Number 2: 52K8601; Supplier 2: Newark; Supplier Part Number 3: 71-CRCW0603-52.3K-E3; Supplier 3: Mouser; RoHS: E; Value1: 1%; MountType: SMT; Supplier 1: Digi-Key; PackageReference: 0603; Tolerance_%: 1%; Res_ohm: 52.3k; PartNumber: CRCW060352K3FKEA; ComponentLink1Description: Datasheet link; Supplier Part Number 1: 541-52.3KHCT-ND; Technology: Thick Film; ComponentLink1URL: http://www.vishay.com/docs/20035/dcrcwe3.pdf
R12 R34 R60 = CMP-0022601-4: RES, 7.50 k, 1%, 0.1 W, AEC-Q200 Grade 0, 0603; Manufacturer: Vishay-Dale; Power_W: 100mW; TempCo: 100 ppm/C; Value_Code: 7k50; Value: 7.50k; EIA_Code: E96; Res_ohm: 7.5k; SizeX_mm: 1.6; SizeY_mm: 0.8; SizeZ_mm: 1; Value2: 0.1W; SizeArea_mm2: 1.28; CompType: Resistor; AEC Qualified: Y; VDC_V: 75V; AEC Category: Q200; AEC Grade: 0; Supplier Part Number 2: 52K8696; Supplier 2: Newark; Supplier Part Number 3: 71-CRCW0603-7.5K-E3; Supplier 3: Mouser; RoHS: E; Value1: 1%; MountType: SMT; Supplier 1: Digi-Key; PackageReference: 0603; Tolerance_%: 1%; PartNumber: CRCW06037K50FKEA; ComponentLink1Description: Datasheet link; Supplier Part Number 1: 541-7.50KHCT-ND; Technology: Thick Film; ComponentLink1URL: http://www.vishay.com/docs/20035/dcrcwe3.pdf
R13 R35 = CMP-0025697-4: RES, 0, 5%, 0.1 W, AEC-Q200 Grade 0, 0603; Manufacturer: Vishay-Dale; Power_W: 100mW; TempCo: 200 ppm/C; Value_Code: 0000; Value: 0; EIA_Code: E24; SizeX_mm: 1.6; SizeY_mm: 0.8; SizeZ_mm: 1; Value2: 0.1W; SizeArea_mm2: 1.28; CompType: Resistor; AEC Qualified: Y; VDC_V: 75V; AEC Category: Q200; Supplier Part Number 2: 52K8014; Supplier 2: Newark; Supplier Part Number 3: 71-CRCW0603-0-E3; Supplier 3: Mouser; RoHS: E; Value1: 5%; MountType: SMT; Supplier 1: Digi-Key; PackageReference: 0603; Tolerance_%: 5%; Res_ohm: 0; PartNumber: CRCW06030000Z0EA; ComponentLink1Description: Datasheet link; Supplier Part Number 1: 541-0.0GCT-ND; Technology: Thick Film; ComponentLink1URL: http://www.vishay.com/docs/20035/dcrcwe3.pdf; AEC Grade: 0
R14 R37 = CMP-0095715-1: NTC Thermistor for Temperature Sensor, Automotive, 0603, 47kΩ, 5%, 0.046mA, 5V; Manufacturer: Murata; B 25 50: 4050K; B 25 100: 4131K; SizeZ_mm: 0.95mm; AEC Qualified: Yes; B 25 85: 4108K; B Tolerance: 1%; Automotive Grade: Grade 0; Digikey Description: THERMISTOR NTC; Mouser Part Number: 81-NCU18WB473D60RB; Datasheet Path: datasheets/Res-NCU18WB473J6SRB.pdf; Value: 47kΩ; Operating Temperature Range: -40°C to +150℃; datasheet: https://www.murata.com/en-eu/products/productdetail.aspx?partno=NCU18WB473J6SRB; RoHS: TRUE; PackageReference: 0603; Max Current: 0.046mA; PartNumber: NCU18WB473J6SRB; Res_ohm: 47kΩ; Tolerance_%: 5%; VDC_V: 5V; Part Number: NCU18WB473J6SRB; ComponentLink1URL: https://www.murata.com/en-eu/products/productdetail.aspx?partno=NCU18WB473J6SRB; helpURL: https://upverter.com/upn/revision/bb5c53bf9c114a2d/; Lead Free: Yes; Digikey Part Number: 490-NCU18WB473D60RBTR-ND; ComponentLink1Description: Datasheet; Series: NCU18
R19 R48 = CMP-0025817-4: RES, 4.7 k, 5%, 0.1 W, AEC-Q200 Grade 0, 0603; Manufacturer: Vishay-Dale; Power_W: 100mW; TempCo: 200 ppm/C; Value_Code: 4k70; Value: 4.7k; EIA_Code: E24; SizeX_mm: 1.6; SizeY_mm: 0.8; SizeZ_mm: 1; Value2: 0.1W; SizeArea_mm2: 1.28; CompType: Resistor; AEC Qualified: Y; VDC_V: 75V; AEC Category: Q200; AEC Grade: 0; Supplier Part Number 2: 59M6811; Supplier 2: Newark; Supplier Part Number 3: 71-CRCW0603J-4.7K-E3; Supplier 3: Mouser; RoHS: E; Value1: 5%; MountType: SMT; Supplier 1: Digi-Key; PackageReference: 0603; Tolerance_%: 5%; Res_ohm: 4.7k; PartNumber: CRCW06034K70JNEA; ComponentLink1Description: Datasheet link; Supplier Part Number 1: 541-4.7KGCT-ND; Technology: Thick Film; ComponentLink1URL: http://www.vishay.com/docs/20035/dcrcwe3.pdf
R20 R36 R49 R62 R63 = CRCW060349R9FKEA: RES, 49.9, 1%, 0.1 W, AEC-Q200 Grade 0, 0603 | PMP23611: R56, R55, R37; Manufacturer: Vishay-Dale; CompType: Resistor; Value: 49.9; Value_Code: 49R9; Power_W: 100mW; Value2: 0.1W; VDC_V: 75V; TempCo: 100 ppm/C; EIA_Code: E96; AEC Category: Q200; AEC Grade: 0; AEC Qualified: Y; SizeArea_mm2: 1.28; SizeX_mm: 1.6; SizeY_mm: 0.8; SizeZ_mm: 1; PartNumber: CRCW060349R9FKEA; PackageReference: 0603; RoHS: E; Res_ohm: 49.9; Tolerance_%: 1%; Value1: 1%; MountType: SMT; Technology: Thick Film; ComponentLink1Description: Datasheet link; ComponentLink1URL: http://www.vishay.com/docs/20035/dcrcwe3.pdf; Supplier 1: Digi-Key; Supplier Part Number 1: 541-49.9HCT-ND; Supplier 2: Newark; Supplier Part Number 2: 52K8566; Supplier 3: Mouser; Supplier Part Number 3: 71-CRCW0603-49.9-E3
R23 = CMP-0022414-4: RES, 41.2 k, 1%, 0.1 W, AEC-Q200 Grade 0, 0603; Manufacturer: Vishay-Dale; Power_W: 100mW; TempCo: 100 ppm/C; Value_Code: 41k2; Value: 41.2k; EIA_Code: E96; SizeX_mm: 1.6; SizeY_mm: 0.8; SizeZ_mm: 1; Value2: 0.1W; SizeArea_mm2: 1.28; CompType: Resistor; AEC Qualified: Y; VDC_V: 75V; AEC Category: Q200; AEC Grade: 0; Supplier Part Number 2: 52K8513; Supplier 2: Newark; Supplier Part Number 3: 71-CRCW0603-41.2K-E3; Supplier 3: Mouser; RoHS: E; Value1: 1%; MountType: SMT; Supplier 1: Digi-Key; PackageReference: 0603; Tolerance_%: 1%; Res_ohm: 41.2k; PartNumber: CRCW060341K2FKEA; ComponentLink1Description: Datasheet link; Supplier Part Number 1: 541-41.2KHCT-ND; Technology: Thick Film; ComponentLink1URL: http://www.vishay.com/docs/20035/dcrcwe3.pdf
R24 = CMP-0022204-4: RES, 20.0 k, 1%, 0.1 W, AEC-Q200 Grade 0, 0603; Manufacturer: Vishay-Dale; Power_W: 100mW; TempCo: 100 ppm/C; Value_Code: 20k0; Value: 20.0k; EIA_Code: E96; Res_ohm: 20k; SizeX_mm: 1.6; SizeY_mm: 0.8; SizeZ_mm: 1; Value2: 0.1W; SizeArea_mm2: 1.28; CompType: Resistor; AEC Qualified: Y; VDC_V: 75V; AEC Category: Q200; AEC Grade: 0; Supplier Part Number 2: 52K8267; Supplier 2: Newark; Supplier Part Number 3: 71-CRCW0603-20K-E3; Supplier 3: Mouser; RoHS: E; Value1: 1%; MountType: SMT; Supplier 1: Digi-Key; PackageReference: 0603; Tolerance_%: 1%; PartNumber: CRCW060320K0FKEA; ComponentLink1Description: Datasheet link; Supplier Part Number 1: 541-20.0KHCT-ND; Technology: Thick Film; ComponentLink1URL: http://www.vishay.com/docs/20035/dcrcwe3.pdf
R38 R41 = CMP-0022101-4: RES, 191 k, 1%, 0.1 W, AEC-Q200 Grade 0, 0603; Manufacturer: Vishay-Dale; Power_W: 100mW; TempCo: 100 ppm/C; Value: 191k; EIA_Code: E96; SizeX_mm: 1.6; SizeY_mm: 0.8; SizeZ_mm: 1; Value2: 0.1W; SizeArea_mm2: 1.28; CompType: Resistor; AEC Qualified: Y; VDC_V: 75V; AEC Category: Q200; AEC Grade: 0; Supplier Part Number 2: 52K8218; Supplier 2: Newark; Supplier Part Number 3: 71-CRCW0603-191K-E3; Supplier 3: Mouser; Value_Code: 191k; RoHS: E; Value1: 1%; MountType: SMT; Supplier 1: Digi-Key; PackageReference: 0603; Tolerance_%: 1%; Res_ohm: 191k; PartNumber: CRCW0603191KFKEA; ComponentLink1Description: Datasheet link; Supplier Part Number 1: 541-191KHCT-ND; Technology: Thick Film; ComponentLink1URL: http://www.vishay.com/docs/20035/dcrcwe3.pdf
R42 R44 R45 = CMP-0021990-4: RES, 100 k, 1%, 0.1 W, AEC-Q200 Grade 0, 0603; Manufacturer: Vishay-Dale; Power_W: 100mW; TempCo: 100 ppm/C; Value: 100k; EIA_Code: E96; SizeX_mm: 1.6; SizeY_mm: 0.8; SizeZ_mm: 1; Value2: 0.1W; SizeArea_mm2: 1.28; CompType: Resistor; AEC Qualified: Y; VDC_V: 75V; AEC Category: Q200; AEC Grade: 0; Supplier Part Number 2: 42K3668; Supplier 2: Newark; Supplier Part Number 3: 71-CRCW0603-100K-E3; Supplier 3: Mouser; Value_Code: 100k; RoHS: E; Value1: 1%; MountType: SMT; Supplier 1: Digi-Key; PackageReference: 0603; Tolerance_%: 1%; Res_ohm: 100k; PartNumber: CRCW0603100KFKEA; ComponentLink1Description: Datasheet link; Supplier Part Number 1: 541-100KHCT-ND; Technology: Thick Film; ComponentLink1URL: http://www.vishay.com/docs/20035/dcrcwe3.pdf
R50 = RC0603FR-0724K9L: RES, 24.9 k, 1%, 0.1 W, 0603 | PMP23611: R46; Manufacturer: Yageo; Power_W: 100mW; TempCo: 100 ppm/C; Value_Code: 24k9; Value: 24.9k; EIA_Code: E96; SizeX_mm: 1.6; SizeY_mm: 0.8; SizeZ_mm: 1; Value2: 0.1W; SizeArea_mm2: 1.28; CompType: Resistor; AEC Qualified: N; VDC_V: 75V; AEC Category: Q200; SizeAreaWB_mm2: 4.68; Supplier Part Number 2: 603-RC0603FR-0724K9L; Supplier 2: Mouser; Supplier Part Number 3: 1799336; Supplier 3: Farnell; RoHS: Y; Value1: 1%; MountType: SMT; Supplier 1: Digi-Key; PackageReference: 0603; Tolerance_%: 1%; Res_ohm: 24.9k; PartNumber: RC0603FR-0724K9L; ComponentLink1Description: Datasheet link; Supplier Part Number 1: 311-24.9KHRCT-ND; Technology: Thick Film; ComponentLink1URL: http://www.yageo.com/pdf/Pu-RC0603_51_PbFree_L_2.pdf; AEC Grade: N/A
R51 = CRCW060352K3FKEA: RES, 52.3 k, 1%, 0.1 W, AEC-Q200 Grade 0, 0603 | PMP23611: R24; Manufacturer: Vishay-Dale; Power_W: 100mW; TempCo: 100 ppm/C; Value_Code: 52k3; Value: 52.3k; EIA_Code: E96; SizeX_mm: 1.6; SizeY_mm: 0.8; SizeZ_mm: 1; Value2: 0.1W; SizeArea_mm2: 1.28; CompType: Resistor; AEC Qualified: Y; VDC_V: 75V; AEC Category: Q200; AEC Grade: 0; Supplier Part Number 2: 52K8601; Supplier 2: Newark; Supplier Part Number 3: 71-CRCW0603-52.3K-E3; Supplier 3: Mouser; RoHS: E; Value1: 1%; MountType: SMT; Supplier 1: Digi-Key; PackageReference: 0603; Tolerance_%: 1%; Res_ohm: 52.3k; PartNumber: CRCW060352K3FKEA; ComponentLink1Description: Datasheet link; Supplier Part Number 1: 541-52.3KHCT-ND; Technology: Thick Film; ComponentLink1URL: http://www.vishay.com/docs/20035/dcrcwe3.pdf
R52 R53 = CMP-0022458-4: RES, 4.99 k, 1%, 0.1 W, AEC-Q200 Grade 0, 0603; Manufacturer: Vishay-Dale; Power_W: 100mW; TempCo: 100 ppm/C; Value_Code: 4k99; Value: 4.99k; EIA_Code: E96; SizeX_mm: 1.6; SizeY_mm: 0.8; SizeZ_mm: 1; Value2: 0.1W; SizeArea_mm2: 1.28; CompType: Resistor; AEC Qualified: Y; VDC_V: 75V; AEC Category: Q200; AEC Grade: 0; Supplier Part Number 2: 52K8500; Supplier 2: Newark; Supplier Part Number 3: 71-CRCW0603-4.99K-E3; Supplier 3: Mouser; RoHS: E; Value1: 1%; MountType: SMT; Supplier 1: Digi-Key; PackageReference: 0603; Tolerance_%: 1%; Res_ohm: 4.99k; PartNumber: CRCW06034K99FKEA; ComponentLink1Description: Datasheet link; Supplier Part Number 1: 541-4.99KHCT-ND; Technology: Thick Film; ComponentLink1URL: http://www.vishay.com/docs/20035/dcrcwe3.pdf
R54 R61 = CRCW060310K0FKEA: RES, 10.0 k, 1%, 0.1 W, AEC-Q200 Grade 0, 0603 | PMP23611: R54, R25, R16, R48, R28, R19, R51, R50, R61, R65, R64; Manufacturer: Vishay-Dale; Power_W: 100mW; TempCo: 100 ppm/C; Value_Code: 10k0; Value: 10.0k; EIA_Code: E96; Res_ohm: 10k; SizeX_mm: 1.6; SizeY_mm: 0.8; SizeZ_mm: 1; Value2: 0.1W; SizeArea_mm2: 1.28; CompType: Resistor; AEC Qualified: Y; VDC_V: 75V; AEC Category: Q200; AEC Grade: 0; Supplier Part Number 2: 52K8062; Supplier 2: Newark; Supplier Part Number 3: 71-CRCW0603-10K-E3; Supplier 3: Mouser; RoHS: E; Value1: 1%; MountType: SMT; Supplier 1: Digi-Key; PackageReference: 0603; Tolerance_%: 1%; PartNumber: CRCW060310K0FKEA; ComponentLink1Description: Datasheet link; Supplier Part Number 1: 541-10.0KHCT-ND; Technology: Thick Film; ComponentLink1URL: http://www.vishay.com/docs/20035/dcrcwe3.pdf
R58 R59 = CRCW06031R00JNEA: RES, 1.0, 5%, 0.1 W, AEC-Q200 Grade 0, 0603 | PMP23611: R52, R53; Manufacturer: Vishay-Dale; Power_W: 100mW; TempCo: 200 ppm/C; Value_Code: 1R00; Value: 1.0; EIA_Code: E24; Res_ohm: 1; SizeX_mm: 1.6; SizeY_mm: 0.8; Value2: 0.1W; SizeArea_mm2: 1.28; CompType: Resistor; AEC Qualified: Y; VDC_V: 75V; AEC Category: Q200; AEC Grade: 0; Supplier Part Number 2: 59M6759; Supplier 2: Newark; Supplier Part Number 3: 71-CRCW0603J-1-E3; Supplier 3: Mouser; RoHS: E; Value1: 5%; MountType: SMT; Supplier 1: Digi-Key; PackageReference: 0603; Tolerance_%: 5%; SizeZ_mm: 1; PartNumber: CRCW06031R00JNEA; ComponentLink1Description: Datasheet link; Supplier Part Number 1: 541-1.0GCT-ND; Technology: Thick Film; ComponentLink1URL: http://www.vishay.com/docs/20035/dcrcwe3.pdf
RT1 = CMP-0123120-1: Automotive ±1% tolerance 10kΩ linear thermistor available in an 0402 package option 2-SOT-5X3 -40 to 150; Manufacturer: Texas Instruments; SizeZ_mm: 0.77mm; AEC Grade: Grade 0; AEC Qualified: Yes; Max Current: 400uA; TaMax_C: +150°C; TaMin_C: -40°C; TempCo: 6400ppm/°C; TJmax_C: +155°C; VDC_V: 5.5V; PackageReference: SOT-523; PartNumber: TMP6131QDYARQ1; RoHS: TRUE; Value: 10kΩ; Part Number: TMP6131QDYARQ1; datasheet: https://www.ti.com/lit/ds/symlink/tmp61-q1.pdf; Datasheet Date: 2023-11; Datasheet Path: datasheets/Res-TMP6131QDYARQ1.pdf; Datasheet Version: SNIS210G; Digikey Description: SENSOR PTC 10KOHM 1% SOT5X3; Digikey Part Number: 296-TMP6131QDYARQ1CT-ND; helpURL: https://upverter.com/upn/revision/9d6f33fa8cb389e1/; Lead Free: Yes; Mouser Description: Automotive, 1%, 10-kO linear thermistor in 0402, 0603/0805 and through hole packages 2-SOT-5X3 -40 to 150; Mouser Part Number: 595-TMP6131QDYARQ1; Operating Temperature Range: -40°C to +150°C; Res_ohm: 10kΩ; Series: TMP61; Tolerance_%: 1%; ComponentLink1Description: Datasheet; ComponentLink1URL: https://www.ti.com/lit/ds/symlink/tmp61-q1.pdf
RT2 RT3 = TMP6131QDYARQ1: Automotive ±1% tolerance 10kO linear thermistor available in an 0402 package option 2-SOT-5X3 -40 to 150 | PMP23611: RT2, RT1; Manufacturer: Texas Instruments; SizeZ_mm: 0.77mm; Value: 10kΩ; AEC Grade: Grade 0; AEC Qualified: Yes; Max Current: 400uA; TaMax_C: +150°C; TaMin_C: -40°C; TempCo: 6400ppm/°C; TJmax_C: +155°C; VDC_V: 5.5V; PackageReference: SOT-523; RoHS: TRUE; Part Number: TMP6131QDYARQ1; datasheet: https://www.ti.com/lit/ds/symlink/tmp61-q1.pdf; Datasheet Date: 2023-11; Datasheet Path: datasheets/Res-TMP6131QDYARQ1.pdf; Datasheet Version: SNIS210G; Digikey Description: SENSOR PTC 10KOHM 1% SOT5X3; Digikey Part Number: 296-TMP6131QDYARQ1CT-ND; helpURL: https://upverter.com/upn/revision/9d6f33fa8cb389e1/; Lead Free: Yes; Mouser Description: Automotive, 1%, 10-kO linear thermistor in 0402, 0603/0805 and through hole packages 2-SOT-5X3 -40 to 150; Mouser Part Number: 595-TMP6131QDYARQ1; Operating Temperature Range: -40°C to +150°C; Res_ohm: 10kΩ; Series: TMP61; Tolerance_%: 1%; ComponentLink1Description: Datasheet; ComponentLink1URL: https://www.ti.com/lit/ds/symlink/tmp61-q1.pdf; PartNumber: TMP6131QDYARQ1
U1 = CMP-0122321-1: Automotive, 4-V to 80-V, Functional Safety-Compliant, Dual Synchronous Buck Controller With Low IQ; Manufacturer: Texas Instruments; SizeZ_mm: 1mm; AEC Qualified: Yes; AEC Grade: Grade 1; Max Duty Cycle: 100%; Max Supply Voltage: 80V; Min Supply Voltage: 4V; Nominal Supply Current: 130uA; Number Of Outputs: 2; Output Type: AdjustableProgrammable; Output Voltage: 0.8-60V; Standoff Height: 0mm; Switching Frequency: 100-2200kHz; TaMax_C: +150°C; TaMin_C: -40°C; PackageReference: VQFN36; RoHS: UNKNOWN; Operating Temperature Range: -40°C to +150°C; Part Number: LM5137FDQRHARQ1; Datasheet Path: datasheets/IC-LM5137FDQRHARQ1.pdf; helpURL: https://upverter.com/upn/revision/27a3924f597904bd/; Switching Topology: Buck; TJmax_C: +150°C; PartNumber: LM5137FDQRHARQ1
U2 U3 = CMP-0121493-2: 100-V, 53-A GaN Half-Bridge Power Stage; Manufacturer: Texas Instruments; SizeZ_mm: 0.85mm; AEC Qualified: No; Max Supply Voltage: 5.25V; Min Supply Voltage: 4.75V; Nominal Supply Current: 12mA; Number Of Drivers: 2; Number Of Outputs: 1; Propagation Delay: 29.5ns; Standoff Height: 0mm; TJmax_C: +150°C; AEC Category: Q200; CompType: IC; PackageReference: VQFN-FCRLF16; PartNumber: LMG2100R026VBNR; RoHS: UNKNOWN; Operating Temperature Range: -40°C to +150°C; Part Number: LMG2100R026VBNR; Datasheet Path: datasheets/IC-LMG2100R026VBNR.pdf; helpURL: https://upverter.com/upn/revision/383ae964fb140d4d/; ComponentLink1Description: Datasheet Link; ComponentLink1URL: http://www.ti.com/lit/ds/symlink/GPN.pdf; ComponentLink2Description: Product Folder; ComponentLink2URL: http://www.ti.com/product/GPN; ComponentLink3Description: Online Datasheet; ComponentLink3URL: http://www.ti.com/product/GPN/datasheet
VIN1 = CMP-0055147-1: Test Point, Multipurpose, Red, TH; Manufacturer: Keystone; PartNumber: 5010; CNHeader: FALSE; Green_Lifecycle: Active; Green_REACh: Passed; ContactFinish: Silver; CT: TRUE; ComponentLink1URL: http://www.keyelco.com/userAssets/file/M60-2p60.pdf; Supplier Part Number 2: 534-5010; Publisher: Texas Instruments; Supplier 2: Mouser; Color: Red; RoHS: Y; MountType: TH; Green_EU RoHS-2: Incomplete; Supplier 1: Digi-Key; Green_EU RoHS: Passed; PackageReference: Red Multipurpose Testpoint; CompType: Test Point; LatestRevisionDate: 26/05/2017; ComponentLink1Description: Datasheet URL; Supplier Part Number 1: 36-5010-ND
VOUT_BODE VOUT_PWR1 = 5010: Test Point, Multipurpose, Red, TH | PMP23611: VIN1, VOUT_PWR1, VOUT_BODE; Manufacturer: Keystone; CNHeader: FALSE; Green_Lifecycle: Active; Green_REACh: Passed; ContactFinish: Silver; CT: TRUE; ComponentLink1URL: http://www.keyelco.com/userAssets/file/M60-2p60.pdf; Supplier Part Number 2: 534-5010; Publisher: Texas Instruments; Supplier 2: Mouser; Color: Red; RoHS: Y; MountType: TH; Green_EU RoHS-2: Incomplete; Supplier 1: Digi-Key; Green_EU RoHS: Passed; PackageReference: Red Multipurpose Testpoint; CompType: Test Point; LatestRevisionDate: 26/05/2017; PartNumber: 5010; ComponentLink1Description: Datasheet URL; Supplier Part Number 1: 36-5010-ND